# Altium schematic sheet Sensor-Sheet.SchDoc: =Projectname
size A4; SheetNumber: 3; SheetTotal: 9
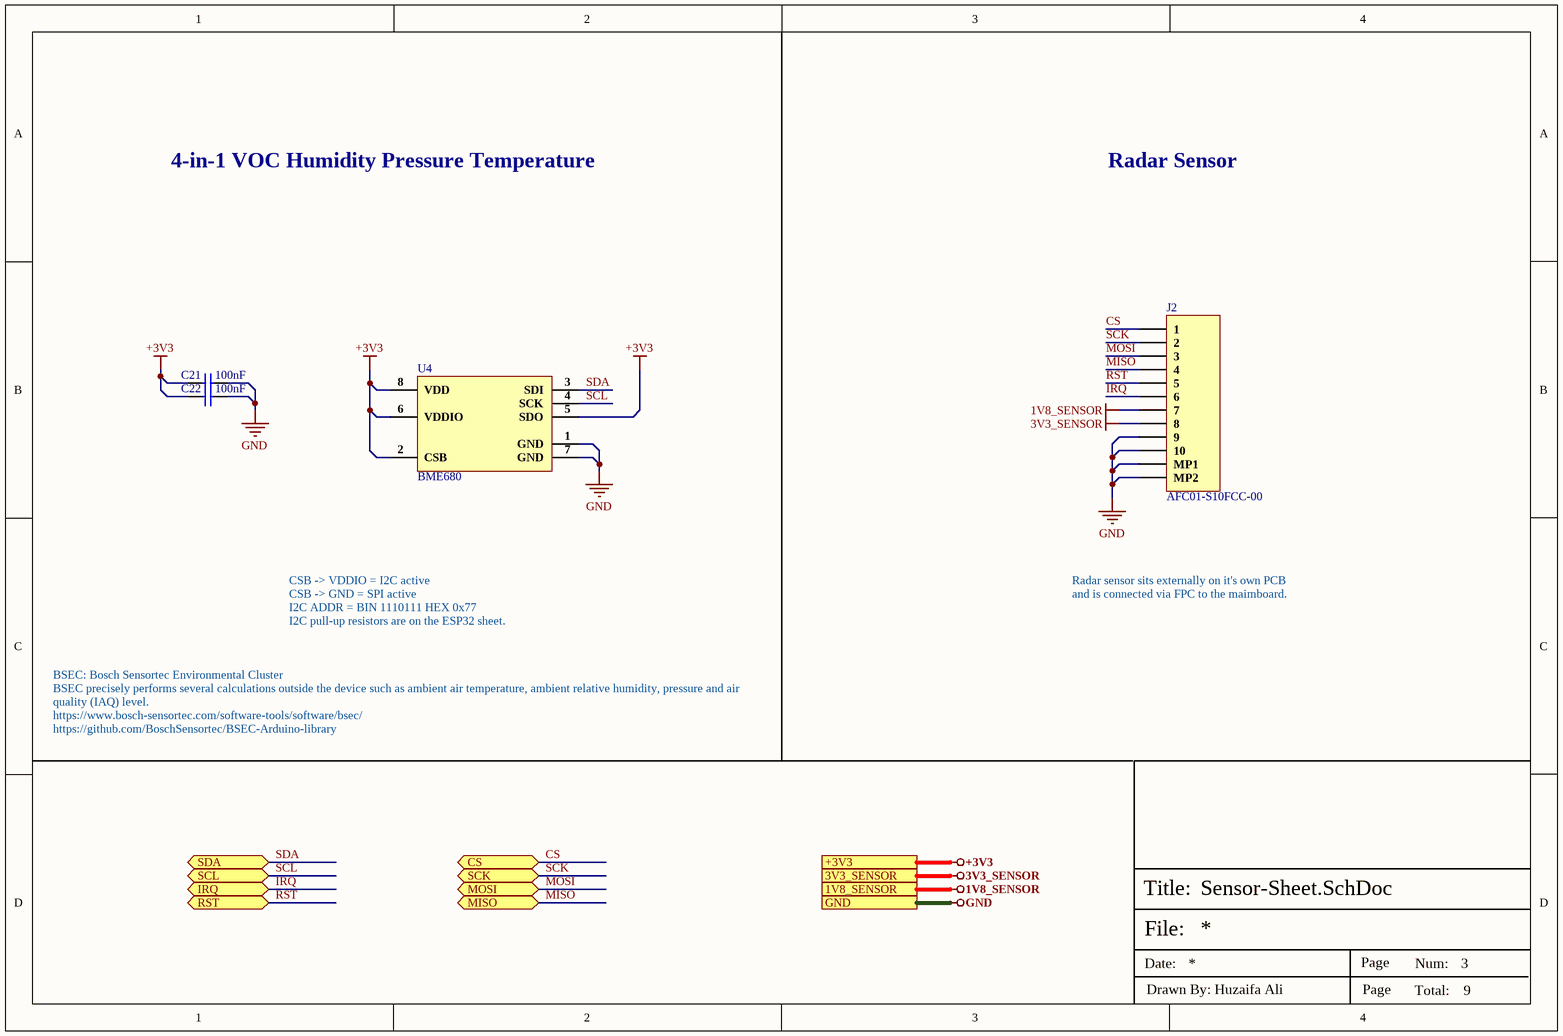
[diagram p0: Sensor-Sheet.SchDoc]

## Parts
C21  100nF  [Cap-0402]
C22  100nF  [Cap-0402]
J2  AFC01-S10FCC-00  [AFC01-S10FCC-00]
U4  BME680  [BME680]

## Ports
1V8_SENSOR, 3V3_SENSOR, +3V3, CS (bidir), GND, IRQ (bidir), MISO (bidir), MOSI (bidir), RST (bidir), SCK (bidir), SCL (bidir), SDA (bidir)

## Nets
1V8_SENSOR: J2.7 ; port 1V8_SENSOR
3V3_SENSOR: J2.8 ; port 3V3_SENSOR
+3V3: C21.1 C22.1 U4.2(CSB) U4.5(SDO) U4.6(VDDIO) U4.8(VDD) ; port +3V3
GND: C21.2 C22.2 J2.9 J2.10 J2.MP1 J2.MP2 U4.1(GND) U4.7(GND) ; port GND
CS: J2.1 ; port CS
IRQ: J2.6 ; port IRQ
MISO: J2.4 ; port MISO
MOSI: J2.3 ; port MOSI
RST: J2.5 ; port RST
SCK: J2.2 ; port SCK
SCL: U4.4(SCK) ; port SCL
SDA: U4.3(SDI) ; port SDA

## Notes on the sheet
- 4-in-1 VOC Humidity Pressure Temperature
- Radar Sensor
- CSB -> VDDIO = I2C active
  CSB -> GND = SPI active
  I2C ADDR = BIN 1110111 HEX 0x77
  I2C pull-up resistors are on the ESP32 sheet.
- Radar sensor sits externally on it's own PCB and is connected via FPC to the maimboard.
- BSEC: Bosch Sensortec Environmental Cluster
  BSEC precisely performs several calculations outside the device such as ambient air temperature, ambient relative humidity, pressure and air quality (IAQ) level.
  https://www.bosch-sensortec.com/software-tools/software/bsec/
  https://github.com/BoschSensortec/BSEC-Arduino-library
- File:
- Title:
- Date:
- Page
- Num:
- Total:
- Drawn By: Huzaifa Ali

## Library data of the parts
C21 C22 = CC0402KRX5R8BB104: CAP CER 0.1UF 25V X5R 0402; Manufacturer: Yageo; Tolerance: 10%; Item Type: Capacitor; Supplier 1: Digi-Key; Manufacturer Part Number: CC0402KRX5R8BB104; RoHS: Yes; Category: Ceramic Capacitors; Stock 1: 4598218; Pricing 1: 1=0.10000, 10=0.03800, 50=0.02100, 100=0.01710, 500=0.01224, 1000=0.00961, 2500=0.00874, 5000=0.00804 (USD); Mount: Surface Mount; Case/Package: 0402; Case Code (Metric): 1005; Case Code (Imperial): 0402; Min Operating Temperature: -55°C; Max Operating Temperature: 85°C; Voltage Rating: 25V; Packaging: Tape and Reel; Capacitance: 100nF; Voltage Rating (DC): 25V; Dielectric: X5R; Resistor Type: Ceramic; Series: CC; Length: 0.039inch; Width: 0.02inch; Thickness: 0.022inch; Depth: 0.5mm; Lead Free: Lead Free; Halogen Free: Halogen Free; RoHS Compliant: Yes; ComponentLink1URL: http://www.mouser.com/ds/2/447/UPY-GPHC_X5R_4V-to-50V_25-1131599.pdf?src-supplier=Mouser; ComponentLink1Description: http://www.mouser.com/ds/2/447/UPY-GPHC_X5R_4V-to-50V_25-1131599.pdf?src-supplier=Mouser; ComponentLink2URL: http://www.yageo.com/documents/recent/UPY-GPHC_X5R_4V-to-50V-16.pdf?src-supplier=Future+Electronics; ComponentLink2Description: http://www.yageo.com/documents/recent/UPY-GPHC_X5R_4V-to-50V-16.pdf?src-supplier=Future+Electronics; ComponentLink3URL: http://www.yageo.com/documents/recent/UPY-GPHC_X5R_4V-to-50V_25.pdf?src-supplier=Digi-Key; ComponentLink3Description: http://www.yageo.com/documents/recent/UPY-GPHC_X5R_4V-to-50V_25.pdf?src-supplier=Digi-Key; Supplier Part Number 1: 311-1697-1-ND; LCSC Part Number: C106256
J2 = AFC01-S10FCC-00: Clamshell 10 Bottom Contact Surface Mount 0.5mm SMD,P=0.5mm FFC/FPC Connectors ROHS; Manufacturer: JUSHUO; Manufacturer Part Number: AFC01-S10FCC-00; Package: SMD,P=0.5mm; LCSC Part Number: C262266; Item Type: FPC Connector; ComponentLink1Description: LCSC; ComponentLink1URL: https://www.lcsc.com/product-detail/FFC-FPC-Connectors_JUSHUO-AFC01-S10FCC-00_C262266.html
U4 = BME680: SENSOR RH PRESSURE TEMP VOC; Manufacturer: Bosch Sensortec; Sensor Type: Temperature; Output Type: SPI,I2C; Item Type: Temperature Sensor; Supplier 1: Future Electronics; Manufacturer Part Number: BME680; RoHS: No; Category: Uncategorized; Stock 1: 64; Pricing 1: 1=9.84000, 20=8.81000, 125=8.18000, 500=7.71000, 3000=7.09000 (USD); Min Operating Temperature: -40°C; Max Operating Temperature: 85°C; ComponentLink1URL: https://ae-bst.resource.bosch.com/media/_tech/media/application_notes/BST-BME680-HS000-05.pdf?src-supplier=Digi-Key; ComponentLink1Description: https://ae-bst.resource.bosch.com/media/_tech/media/application_notes/BST-BME680-HS000-05.pdf?src-supplier=Digi-Key; ComponentLink2URL: https://ae-bst.resource.bosch.com/media/_tech/media/product_flyer/BST-BME680-FL000.pdf?src-supplier=Digi-Key; ComponentLink2Description: https://ae-bst.resource.bosch.com/media/_tech/media/product_flyer/BST-BME680-FL000.pdf?src-supplier=Digi-Key; Supplier Part Number 1: 7107186; LCSC Part Number: C125972